# Altium schematic sheet A313-2.SchDoc
size 817 x 513 mm
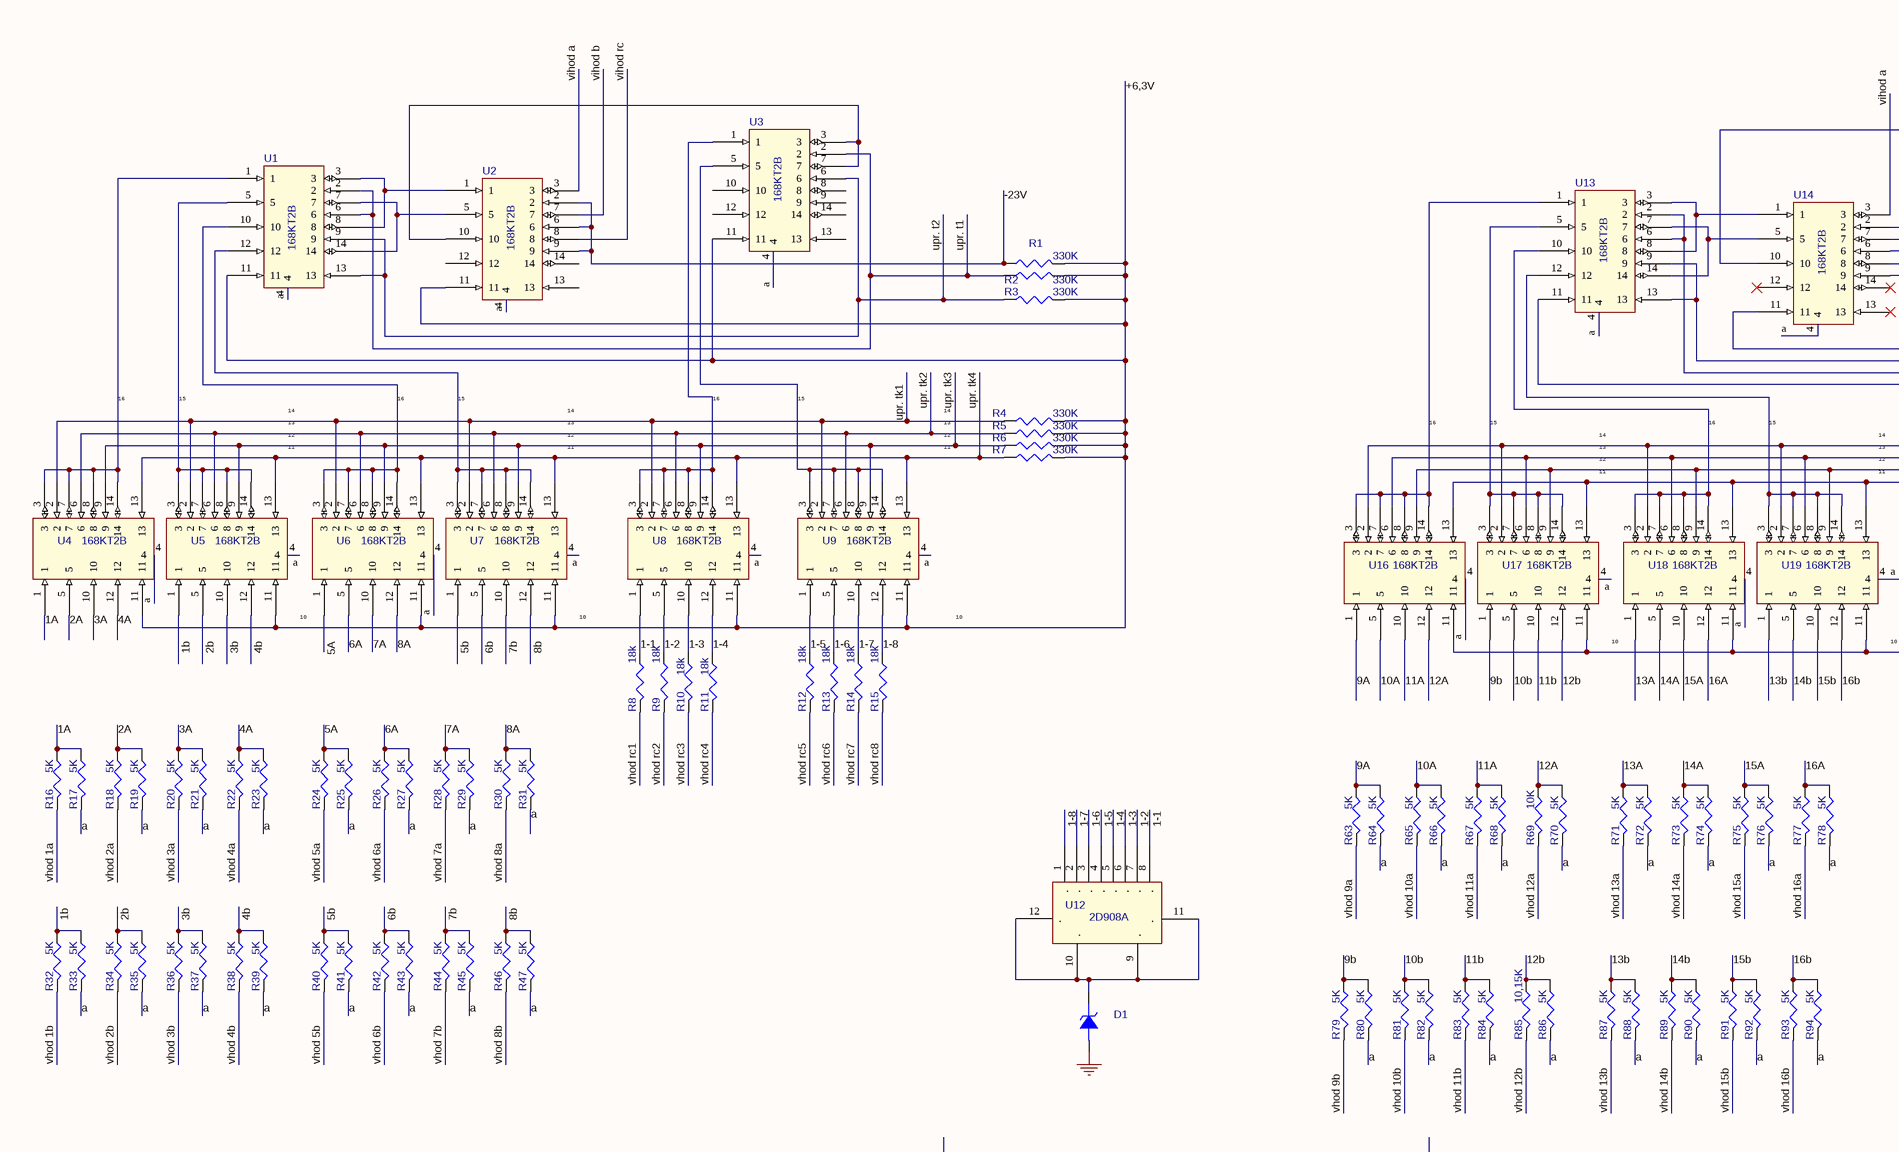
[diagram p0: A313-2.SchDoc, top left]
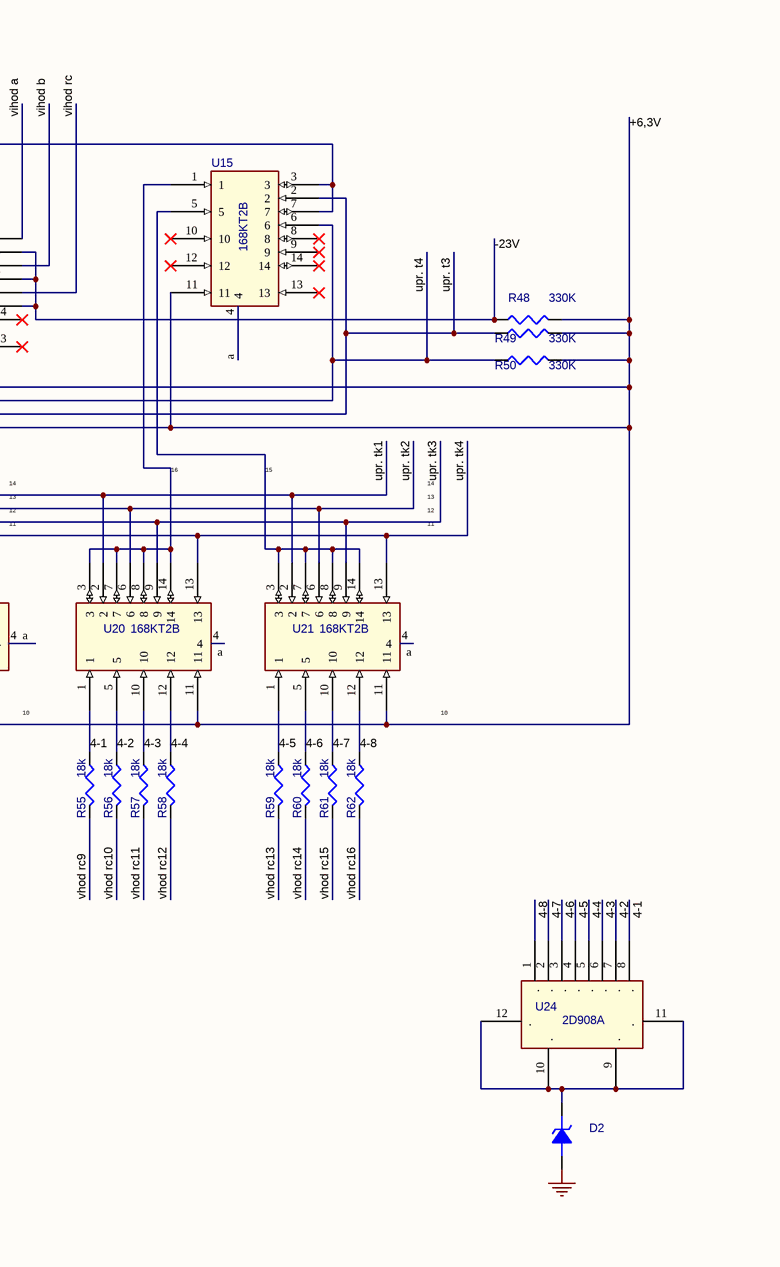
[diagram p1: A313-2.SchDoc, top right]
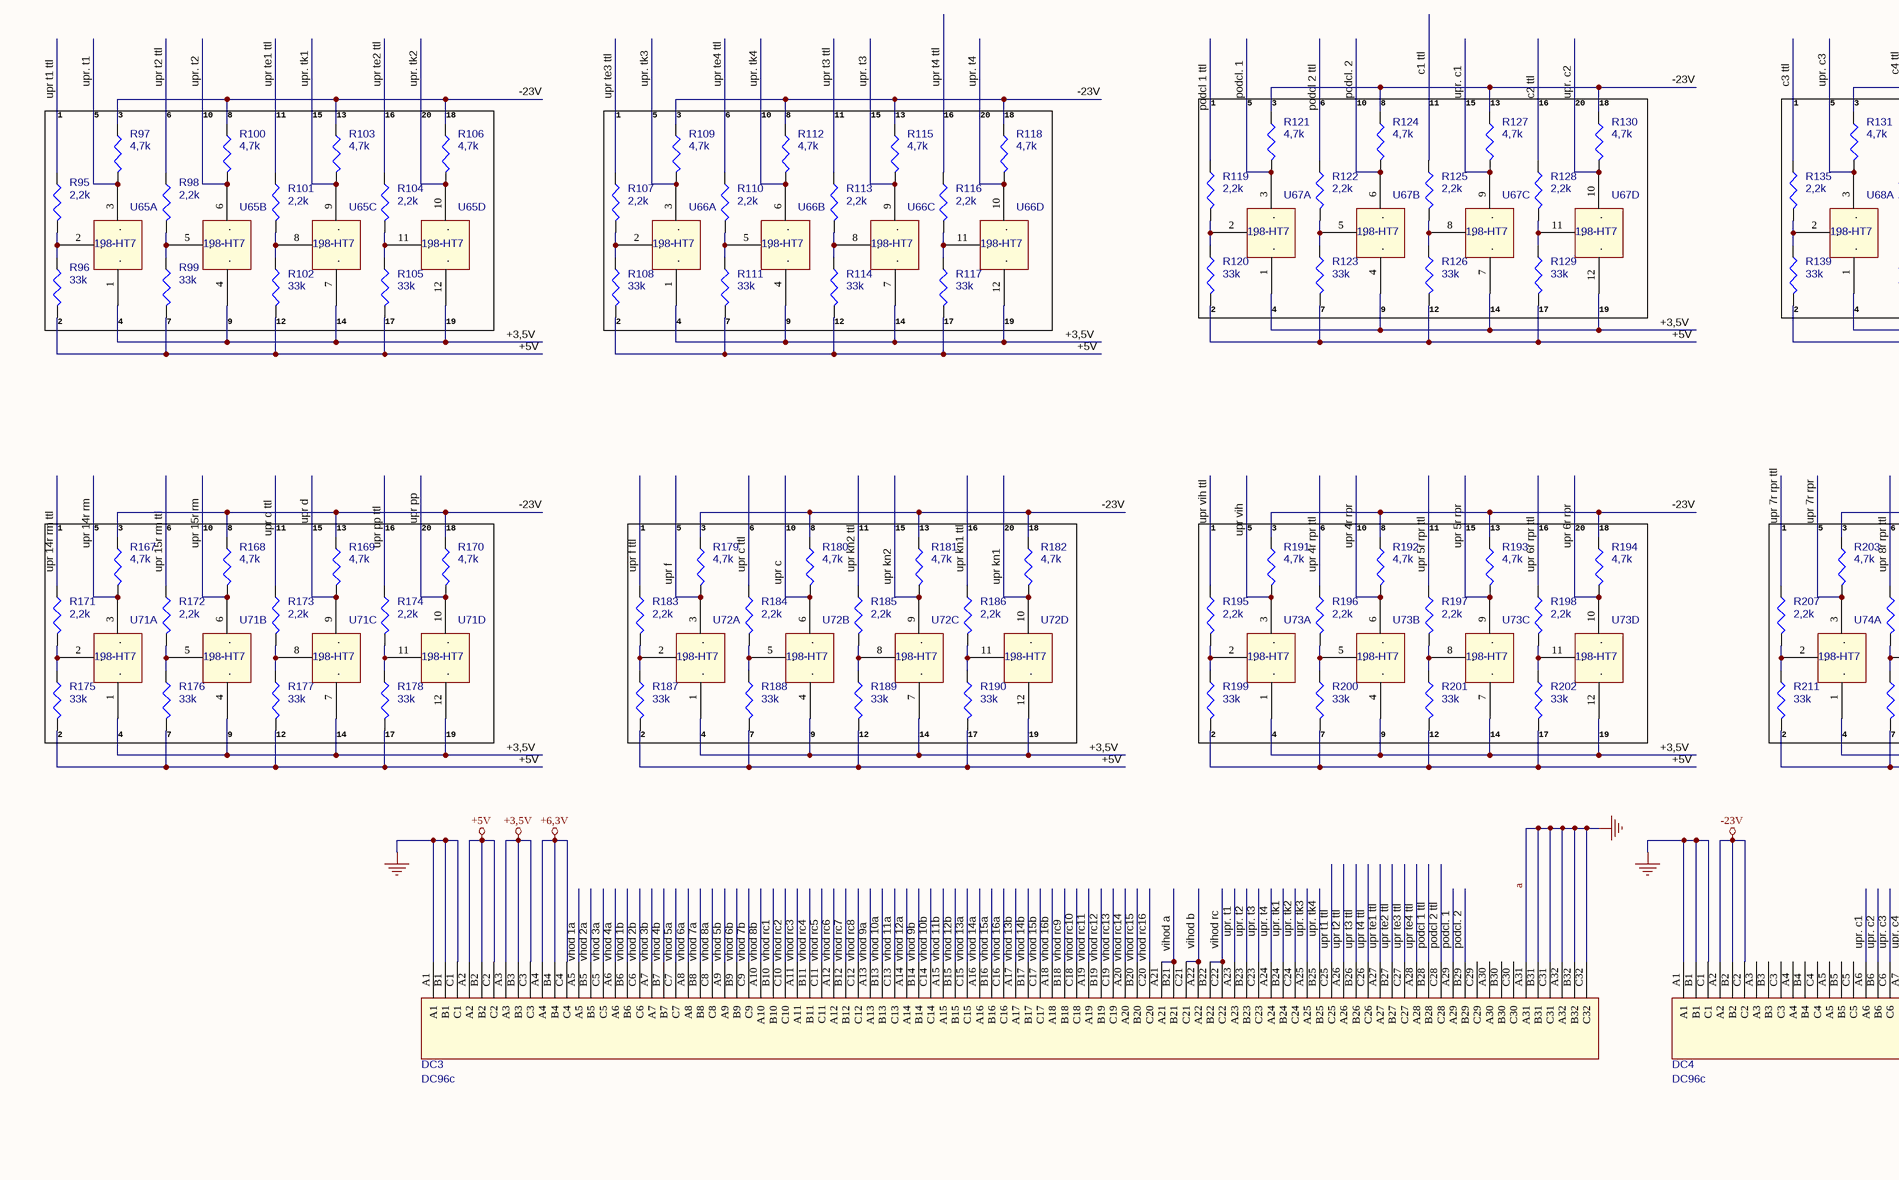
[diagram p2: A313-2.SchDoc, bottom left]
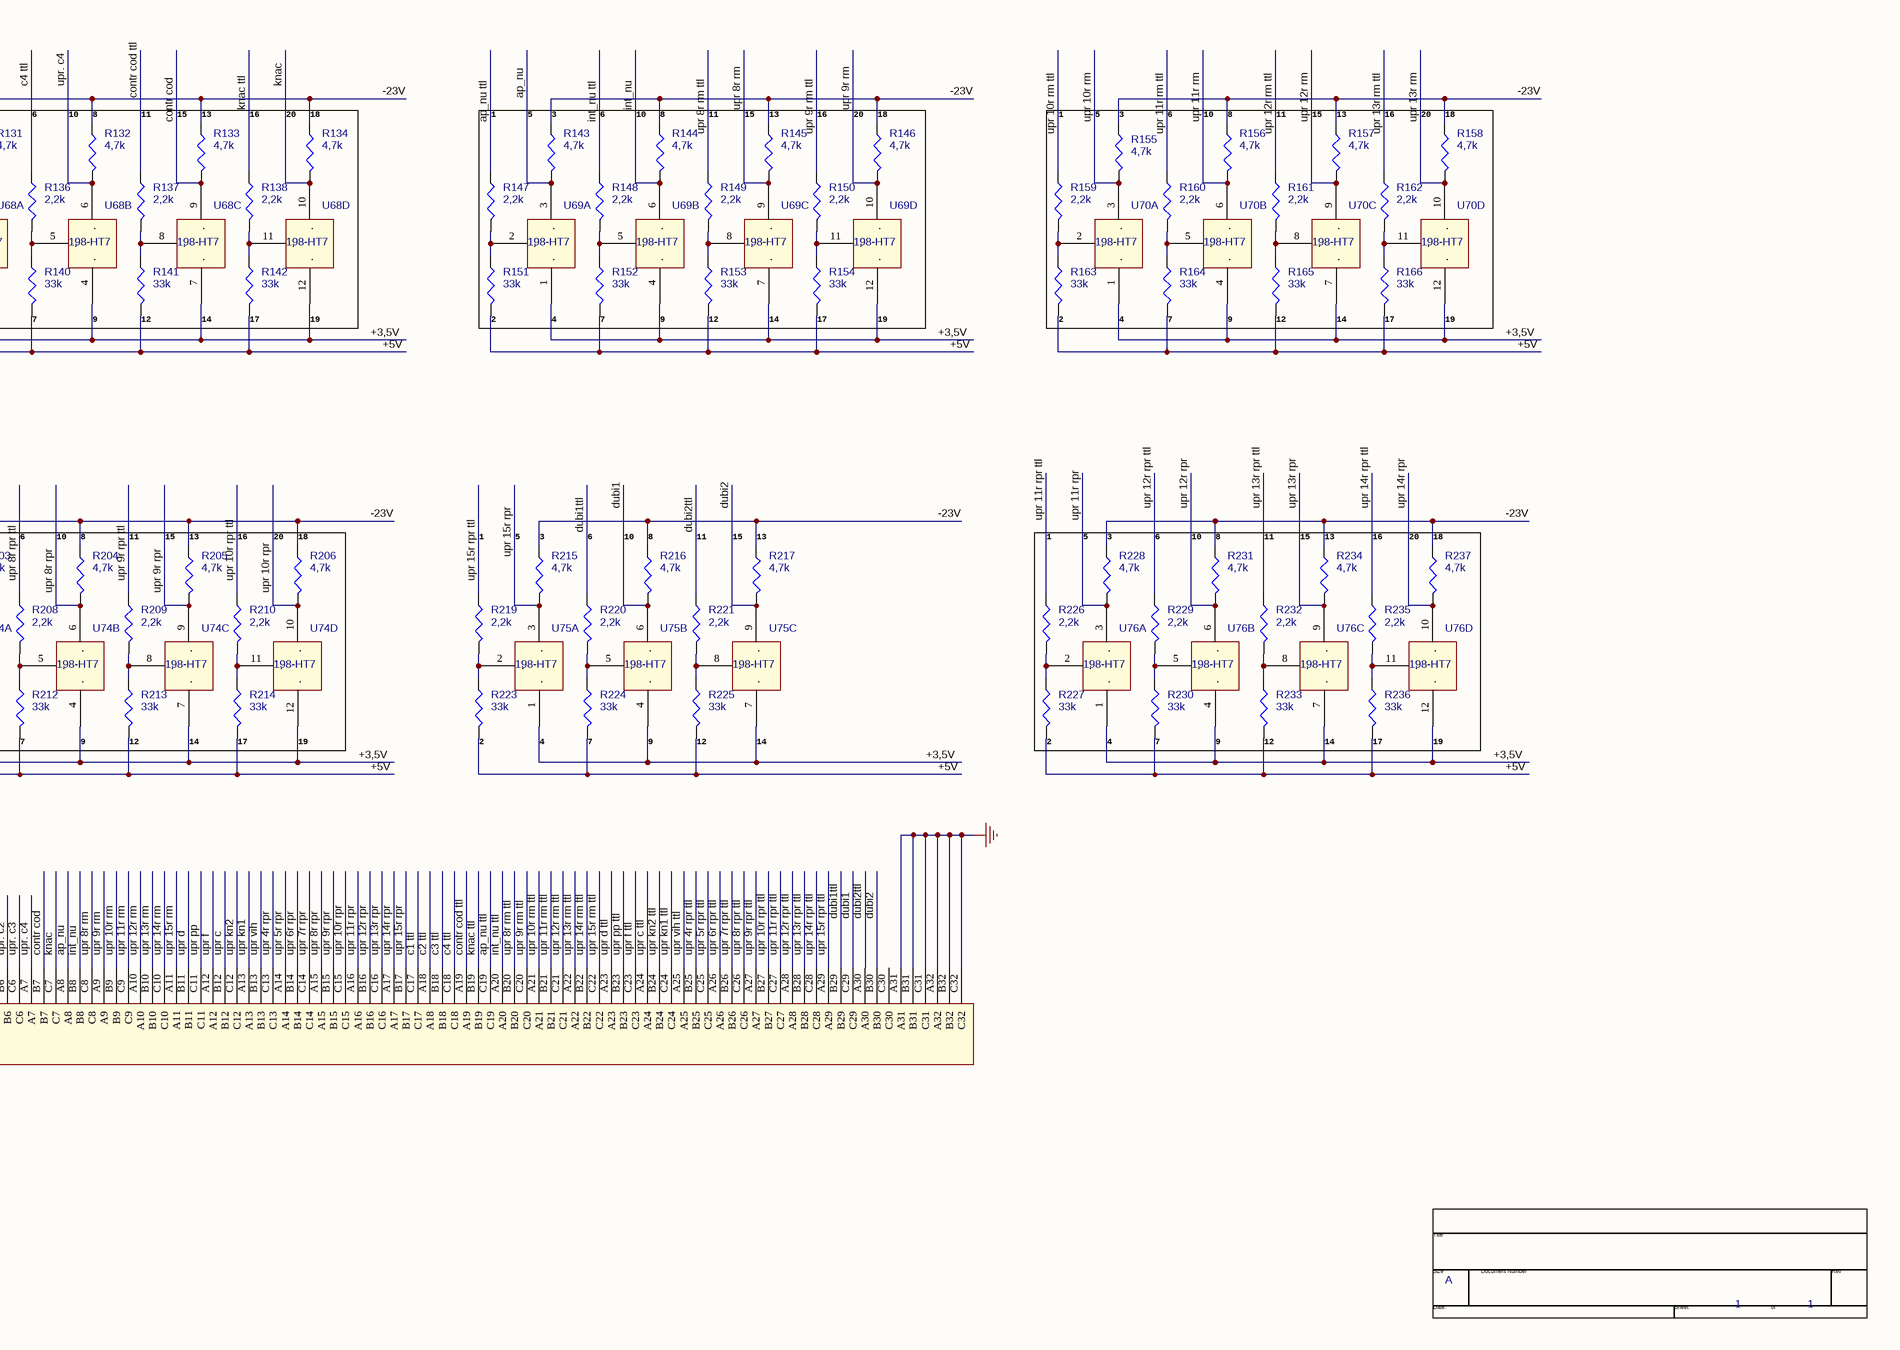
[diagram p3: A313-2.SchDoc, bottom right]

## Parts
*  Page Count: 1  Page Size: A  (hidden comment: TitleBlock0)  (graphical)
D1  2C133A  [DIODE ZENER]  (value not drawn)
D2  DIODE ZENER  [DIODE ZENER]  (value not drawn)
DC3  DC96c  [DC96c_DUC]
DC4  DC96c  [DC96c_DUC]
R1  330K  [R0805]
R2  330K  [R0805]
R3  330K  [R0805]
R4  330K  [R0805]
R5  330K  [R0805]
R6  330K  [R0805]
R7  330K  [R0805]
R8  18k  [R0805]
R9  18k  [R0805]
R10  18k  [R0805]
R11  18k  [R0805]
R12  18k  [R0805]
R13  18k  [R0805]
R14  18k  [R0805]
R15  18k  [R0805]
R16  5K  [R0805]
R17  5K  [R0805]
R18  5K  [R0805]
R19  5K  [R0805]
R20  5K  [R0805]
R21  5K  [R0805]
R22  5K  [R0805]
R23  5K  [R0805]
R24  5K  [R0805]
R25  5K  [R0805]
R26  5K  [R0805]
R27  5K  [R0805]
R28  5K  [R0805]
R29  5K  [R0805]
R30  5K  [R0805]
R31  5K  [R0805]
R32  5K  [R0805]
R33  5K  [R0805]
R34  5K  [R0805]
R35  5K  [R0805]
R36  5K  [R0805]
R37  5K  [R0805]
R38  5K  [R0805]
R39  5K  [R0805]
R40  5K  [R0805]
R41  5K  [R0805]
R42  5K  [R0805]
R43  5K  [R0805]
R44  5K  [R0805]
R45  5K  [R0805]
R46  5K  [R0805]
R47  5K  [R0805]
R48  330K  [R0805]
R49  330K  [R0805]
R50  330K  [R0805]
R55  18k  [R0805]
R56  18k  [R0805]
R57  18k  [R0805]
R58  18k  [R0805]
R59  18k  [R0805]
R60  18k  [R0805]
R61  18k  [R0805]
R62  18k  [R0805]
R63  5K  [R0805]
R64  5K  [R0805]
R65  5K  [R0805]
R66  5K  [R0805]
R67  5K  [R0805]
R68  5K  [R0805]
R69  10K  [R0805]
R70  5K  [R0805]
R71  5K  [R0805]
R72  5K  [R0805]
R73  5K  [R0805]
R74  5K  [R0805]
R75  5K  [R0805]
R76  5K  [R0805]
R77  5K  [R0805]
R78  5K  [R0805]
R79  5K  [R0805]
R80  5K  [R0805]
R81  5K  [R0805]
R82  5K  [R0805]
R83  5K  [R0805]
R84  5K  [R0805]
R85  10,15K  [R0805]
R86  5K  [R0805]
R87  5K  [R0805]
R88  5K  [R0805]
R89  5K  [R0805]
R90  5K  [R0805]
R91  5K  [R0805]
R92  5K  [R0805]
R93  5K  [R0805]
R94  5K  [R0805]
R95  2,2k  [R0805]
R96  33k  [R0805]
R97  4,7k  [R0805]
R98  2,2k  [R0805]
R99  33k  [R0805]
R100  4,7k  [R0805]
R101  2,2k  [R0805]
R102  33k  [R0805]
R103  4,7k  [R0805]
R104  2,2k  [R0805]
R105  33k  [R0805]
R106  4,7k  [R0805]
R107  2,2k  [R0805]
R108  33k  [R0805]
R109  4,7k  [R0805]
R110  2,2k  [R0805]
R111  33k  [R0805]
R112  4,7k  [R0805]
R113  2,2k  [R0805]
R114  33k  [R0805]
R115  4,7k  [R0805]
R116  2,2k  [R0805]
R117  33k  [R0805]
R118  4,7k  [R0805]
R119  2,2k  [R0805]
R120  33k  [R0805]
R121  4,7k  [R0805]
R122  2,2k  [R0805]
R123  33k  [R0805]
R124  4,7k  [R0805]
R125  2,2k  [R0805]
R126  33k  [R0805]
R127  4,7k  [R0805]
R128  2,2k  [R0805]
R129  33k  [R0805]
R130  4,7k  [R0805]
R131  4,7k  [R0805]
R132  4,7k  [R0805]
R133  4,7k  [R0805]
R134  4,7k  [R0805]
R135  2,2k  [R0805]
R136  2,2k  [R0805]
R137  2,2k  [R0805]
R138  2,2k  [R0805]
R139  33k  [R0805]
R140  33k  [R0805]
R141  33k  [R0805]
R142  33k  [R0805]
R143  4,7k  [R0805]
R144  4,7k  [R0805]
R145  4,7k  [R0805]
R146  4,7k  [R0805]
R147  2,2k  [R0805]
R148  2,2k  [R0805]
R149  2,2k  [R0805]
R150  2,2k  [R0805]
R151  33k  [R0805]
R152  33k  [R0805]
R153  33k  [R0805]
R154  33k  [R0805]
R155  4,7k  [R0805]
R156  4,7k  [R0805]
R157  4,7k  [R0805]
R158  4,7k  [R0805]
R159  2,2k  [R0805]
R160  2,2k  [R0805]
R161  2,2k  [R0805]
R162  2,2k  [R0805]
R163  33k  [R0805]
R164  33k  [R0805]
R165  33k  [R0805]
R166  33k  [R0805]
R167  4,7k  [R0805]
R168  4,7k  [R0805]
R169  4,7k  [R0805]
R170  4,7k  [R0805]
R171  2,2k  [R0805]
R172  2,2k  [R0805]
R173  2,2k  [R0805]
R174  2,2k  [R0805]
R175  33k  [R0805]
R176  33k  [R0805]
R177  33k  [R0805]
R178  33k  [R0805]
R179  4,7k  [R0805]
R180  4,7k  [R0805]
R181  4,7k  [R0805]
R182  4,7k  [R0805]
R183  2,2k  [R0805]
R184  2,2k  [R0805]
R185  2,2k  [R0805]
R186  2,2k  [R0805]
R187  33k  [R0805]
R188  33k  [R0805]
R189  33k  [R0805]
R190  33k  [R0805]
R191  4,7k  [R0805]
R192  4,7k  [R0805]
R193  4,7k  [R0805]
R194  4,7k  [R0805]
R195  2,2k  [R0805]
R196  2,2k  [R0805]
R197  2,2k  [R0805]
R198  2,2k  [R0805]
R199  33k  [R0805]
R200  33k  [R0805]
R201  33k  [R0805]
R202  33k  [R0805]
R203  4,7k  [R0805]
R204  4,7k  [R0805]
R205  4,7k  [R0805]
R206  4,7k  [R0805]
R207  2,2k  [R0805]
R208  2,2k  [R0805]
R209  2,2k  [R0805]
R210  2,2k  [R0805]
R211  33k  [R0805]
R212  33k  [R0805]
R213  33k  [R0805]
R214  33k  [R0805]
R215  4,7k  [R0805]
R216  4,7k  [R0805]
R217  4,7k  [R0805]
R219  2,2k  [R0805]
R220  2,2k  [R0805]
R221  2,2k  [R0805]
R223  33k  [R0805]
R224  33k  [R0805]
R225  33k  [R0805]
R226  2,2k  [R0805]
R227  33k  [R0805]
R228  4,7k  [R0805]
R229  2,2k  [R0805]
R230  33k  [R0805]
R231  4,7k  [R0805]
R232  2,2k  [R0805]
R233  33k  [R0805]
R234  4,7k  [R0805]
R235  2,2k  [R0805]
R236  33k  [R0805]
R237  4,7k  [R0805]
U1  168KT2B  [168kt2b]
U2  168KT2B  [168kt2b]
U3  168KT2B  [168kt2b]
U4  168KT2B  [168kt2b]
U5  168KT2B  [168kt2b]
U6  168KT2B  [168kt2b]
U7  168KT2B  [168kt2b]
U8  168KT2B  [168kt2b]
U9  168KT2B  [168kt2b]
U12  2D908A  [2d908a]
U13  168KT2B  [168kt2b]
U14  168KT2B  [168kt2b]
U15  168KT2B  [168kt2b]
U16  168KT2B  [168kt2b]
U17  168KT2B  [168kt2b]
U18  168KT2B  [168kt2b]
U19  168KT2B  [168kt2b]
U20  168KT2B  [168kt2b]
U21  168KT2B  [168kt2b]
U24  2D908A  [2d908a]
U65  198-HT7  [198-ht7]  (parts A,B,C,D of 4)
U66  198-HT7  [198-ht7]  (parts A,B,C,D of 4)
U67  198-HT7  [198-ht7]  (parts A,B,C,D of 4)
U68  198-HT7  [198-ht7]  (parts A,B,C,D of 4)
U69  198-HT7  [198-ht7]  (parts A,B,C,D of 4)
U70  198-HT7  [198-ht7]  (parts A,B,C,D of 4)
U71  198-HT7  [198-ht7]  (parts A,B,C,D of 4)
U72  198-HT7  [198-ht7]  (parts A,B,C,D of 4)
U73  198-HT7  [198-ht7]  (parts A,B,C,D of 4)
U74  198-HT7  [198-ht7]  (parts A,B,C,D of 4)
U75  198-HT7  [198-ht7]  (parts A,B,C of 4)
U76  198-HT7  [198-ht7]  (parts A,B,C,D of 4)

## Nets
+3,5V: DC3.A3 DC3.B3 DC3.C3 U65.1(.) U65.4(.) U65.7(.) U65.12(.) U66.1(.) U66.4(.) U66.7(.) U66.12(.) U67.1(.) U67.4(.) U67.7(.) U67.12(.) U68.1(.) U68.4(.) U68.7(.) U68.12(.) U69.1(.) U69.4(.) U69.7(.) U69.12(.) U70.1(.) U70.4(.) U70.7(.) U70.12(.) U71.1(.) U71.4(.) U71.7(.) U71.12(.) U72.1(.) U72.4(.) U72.7(.) U72.12(.) U73.1(.) U73.4(.) U73.7(.) U73.12(.) U74.1(.) U74.4(.) U74.7(.) U74.12(.) U75.1(.) U75.4(.) U75.7(.) U76.1(.) U76.4(.) U76.7(.) U76.12(.)
+5V: DC3.A2 DC3.B2 DC3.C2 R96.2 R99.2 R102.2 R105.2 R108.2 R111.2 R114.2 R117.2 R120.2 R123.2 R126.2 R129.2 R139.2 R140.2 R141.2 R142.2 R151.2 R152.2 R153.2 R154.2 R163.2 R164.2 R165.2 R166.2 R175.2 R176.2 R177.2 R178.2 R187.2 R188.2 R189.2 R190.2 R199.2 R200.2 R201.2 R202.2 R211.2 R212.2 R213.2 R214.2 R223.2 R224.2 R225.2 R227.2 R230.2 R233.2 R236.2
+6,3V: DC3.A4 DC3.B4 DC3.C4 R1.2 R2.2 R3.2 R4.2 R5.2 R6.2 R7.2 R48.2 R49.2 R50.2 U1.11 U2.11 U3.11 U4.11 U5.11 U6.11 U7.11 U8.11 U9.11 U13.11 U14.11 U15.11 U16.11 U17.11 U18.11 U19.11 U20.11 U21.11
-23V: DC4.A2 DC4.A19 DC4.B2 DC4.C2 R1.1 R48.1 R97.1 R100.1 R103.1 R106.1 R109.1 R112.1 R115.1 R118.1 R121.1 R124.1 R127.1 R130.1 R131.1 R132.1 R133.1 R134.1 R137.1 R143.1 R144.1 R145.1 R146.1 R155.1 R156.1 R157.1 R158.1 R167.1 R168.1 R169.1 R170.1 R179.1 R180.1 R181.1 R182.1 R191.1 R192.1 R193.1 R194.1 R203.1 R204.1 R205.1 R206.1 R215.1 R216.1 R217.1 R228.1 R231.1 R234.1 R237.1 U2.2 U2.6 U2.9 U14.2 U14.6 U14.9  [also labelled contr cod ttl]
.: U65.13(.) U65.14(.) U66.13(.) U66.14(.) U67.13(.) U67.14(.) U68.13(.) U68.14(.) U69.13(.) U69.14(.) U70.13(.) U70.14(.) U71.13(.) U71.14(.) U72.13(.) U72.14(.) U73.13(.) U73.14(.) U74.13(.) U74.14(.) U75.13(.) U75.14(.) U76.13(.) U76.14(.)
a: D1.1(ANODE) D2.1(ANODE) DC3.A1 DC3.A31 DC3.A32 DC3.B1 DC3.B31 DC3.B32 DC3.C1 DC3.C31 DC3.C32 DC4.A1 DC4.A31 DC4.A32 DC4.B1 DC4.B31 DC4.B32 DC4.C1 DC4.C31 DC4.C32 R17.2 R19.2 R21.2 R23.2 R25.2 R27.2 R29.2 R31.2 R33.2 R35.2 R37.2 R39.2 R41.2 R43.2 R45.2 R47.2 R64.2 R66.2 R68.2 R70.2 R72.2 R74.2 R76.2 R78.2 R80.2 R82.2 R84.2 R86.2 R88.2 R90.2 R92.2 R94.2 U1.4 U2.4 U3.4 U4.4 U5.4 U6.4 U7.4 U8.4 U9.4 U13.4 U14.4 U15.4 U16.4 U17.4 U18.4 U19.4 U20.4 U21.4  [also labelled GND]
1-1: R8.1 U8.1 U12.8(.)
1-2: R9.1 U8.5 U12.7(.)
1-3: R10.1 U8.10 U12.6(.)
1-4: R11.1 U8.12 U12.5(.)
1-5: R12.1 U9.1 U12.4(.)
1-6: R13.1 U9.5 U12.3(.)
1-7: R14.1 U9.10 U12.2(.)
1-8: R15.1 U9.12 U12.1(.)
1A: R16.1 R17.1 U4.1
1b: R32.1 R33.1 U5.1
2A: R18.1 R19.1 U4.5
2b: R34.1 R35.1 U5.5
3A: R20.1 R21.1 U4.10
3b: R36.1 R37.1 U5.10
4-1: R55.1 U20.1 U24.8(.)
4-2: R56.1 U20.5 U24.7(.)
4-3: R57.1 U20.10 U24.6(.)
4-4: R58.1 U20.12 U24.5(.)
4-5: R59.1 U21.1 U24.4(.)
4-6: R60.1 U21.5 U24.3(.)
4-7: R61.1 U21.10 U24.2(.)
4-8: R62.1 U21.12 U24.1(.)
4A: R22.1 R23.1 U4.12
4b: R38.1 R39.1 U5.12
5A: R24.1 R25.1 U6.1
5b: R40.1 R41.1 U7.1
6A: R26.1 R27.1 U6.5
6b: R42.1 R43.1 U7.5
7A: R28.1 R29.1 U6.10
7b: R44.1 R45.1 U7.10
8A: R30.1 R31.1 U6.12
8b: R46.1 R47.1 U7.12
9A: R63.1 R64.1 U16.1
9b: R79.1 R80.1 U17.1
10A: R65.1 R66.1 U16.5
10b: R81.1 R82.1 U17.5
11A: R67.1 R68.1 U16.10
11b: R83.1 R84.1 U17.10
12A: R69.1 R70.1 U16.12
12b: R85.1 R86.1 U17.12
13A: R71.1 R72.1 U18.1
13b: R87.1 R88.1 U19.1
14A: R73.1 R74.1 U18.5
14b: R89.1 R90.1 U19.5
15A: R75.1 R76.1 U18.10
15b: R91.1 R92.1 U19.10
16A: R77.1 R78.1 U18.12
16b: R93.1 R94.1 U19.12
ap_nu: DC4.A8 R143.2 U69.3(.)
ap_nu ttl: DC4.C19 R147.1
c1 ttl: DC4.C17 R125.1
c2 ttl: DC4.A18 R128.1
c3 ttl: DC4.B18 R135.1
c4 ttl: DC4.C18 R136.1
contr cod: DC4.B7 R133.2 U68.9(.)
dubi1: DC4.C29 R216.2 U75.6(.)
dubi1ttl: DC4.B29 R220.1
dubi2: DC4.B30 R217.2 U75.9(.)
dubi2ttl: DC4.A30 R221.1
int_nu: DC4.B8 R144.2 U69.6(.)
int_nu ttl: DC4.A20 R148.1
knac: DC4.C7 R134.2 U68.10(.)
knac ttl: DC4.B19 R138.1
podcl 1 ttl: DC3.B28 R119.1
podcl 2 ttl: DC3.C28 R122.1
podcl. 1: DC3.A29 R121.2 U67.3(.)
podcl. 2: DC3.B29 R124.2 U67.6(.)
upr 4r rpr: DC4.C13 R192.2 U73.6(.)
upr 4r rpr ttl: DC4.B25 R196.1
upr 5r rpr: DC4.A14 R193.2 U73.9(.)
upr 5r rpr ttl: DC4.C25 R197.1
upr 6r rpr: DC4.B14 R194.2 U73.10(.)
upr 6r rpr ttl: DC4.A26 R198.1
upr 7r rpr: DC4.C14 R203.2 U74.3(.)
upr 7r rpr ttl: DC4.B26 R207.1
upr 8r rm: DC4.C8 R145.2 U69.9(.)
upr 8r rm ttl: DC4.B20 R149.1
upr 8r rpr: DC4.A15 R204.2 U74.6(.)
upr 8r rpr ttl: DC4.C26 R208.1
upr 9r rm: DC4.A9 R146.2 U69.10(.)
upr 9r rm ttl: DC4.C20 R150.1
upr 9r rpr: DC4.B15 R205.2 U74.9(.)
upr 9r rpr ttl: DC4.A27 R209.1
upr 10r rm: DC4.B9 R155.2 U70.3(.)
upr 10r rm ttl: DC4.A21 R159.1
upr 10r rpr: DC4.C15 R206.2 U74.10(.)
upr 10r rpr ttl: DC4.B27 R210.1
upr 11r rm: DC4.C9 R156.2 U70.6(.)
upr 11r rm ttl: DC4.B21 R160.1
upr 11r rpr: DC4.A16 R228.2 U76.3(.)
upr 11r rpr ttl: DC4.C27 R226.1
upr 12r rm: DC4.A10 R157.2 U70.9(.)
upr 12r rm ttl: DC4.C21 R161.1
upr 12r rpr: DC4.B16 R231.2 U76.6(.)
upr 12r rpr ttl: DC4.A28 R229.1
upr 13r rm: DC4.B10 R158.2 U70.10(.)
upr 13r rm ttl: DC4.A22 R162.1
upr 13r rpr: DC4.C16 R234.2 U76.9(.)
upr 13r rpr ttl: DC4.B28 R232.1
upr 14r rm: DC4.C10 R167.2 U71.3(.)
upr 14r rm ttl: DC4.B22 R171.1
upr 14r rpr: DC4.A17 R237.2 U76.10(.)
upr 14r rpr ttl: DC4.C28 R235.1
upr 15r rm: DC4.A11 R168.2 U71.6(.)
upr 15r rm ttl: DC4.C22 R172.1
upr 15r rpr: DC4.B17 R215.2 U75.3(.)
upr 15r rpr ttl: DC4.A29 R219.1
upr c: DC4.B12 R180.2 U72.6(.)
upr c ttl: DC4.A24 R184.1
upr d: DC4.B11 R169.2 U71.9(.)
upr d ttl: DC4.A23 R173.1
upr f: DC4.A12 R179.2 U72.3(.)
upr f ttl: DC4.C23 R183.1
upr kn1: DC4.A13 R182.2 U72.10(.)
upr kn1 ttl: DC4.C24 R186.1
upr kn2: DC4.C12 R181.2 U72.9(.)
upr kn2 ttl: DC4.B24 R185.1
upr pp: DC4.C11 R170.2 U71.10(.)
upr pp ttl: DC4.B23 R174.1
upr t1 ttl: DC3.C25 R95.1
upr t2 ttl: DC3.A26 R98.1
upr t3 ttl: DC3.B26 R113.1
upr t4 ttl: DC3.C26 R116.1
upr te1 ttl: DC3.A27 R101.1
upr te2 ttl: DC3.B27 R104.1
upr te3 ttl: DC3.C27 R107.1
upr te4 ttl: DC3.A28 R110.1
upr vih: DC4.B13 R191.2 U73.3(.)
upr vih ttl: DC4.A25 R195.1
upr. c1: DC4.A6 R127.2 U67.9(.)
upr. c2: DC4.B6 R130.2 U67.10(.)
upr. c3: DC4.C6 R131.2 U68.3(.)
upr. c4: DC4.A7 R132.2 U68.6(.)
upr. t1: DC3.A23 R2.1 R97.2 U1.2 U1.6 U3.2 U65.3(.)
upr. t2: DC3.B23 R3.1 R100.2 U1.9 U1.13 U3.6 U65.6(.)
upr. t3: DC3.C23 R49.1 R115.2 U13.2 U13.6 U15.2 U66.9(.)
upr. t4: DC3.A24 R50.1 R118.2 U13.9 U13.13 U15.6 U66.10(.)
upr. tk1: DC3.B24 R4.1 R103.2 U4.2 U5.2 U6.2 U7.2 U8.2 U9.2 U16.2 U17.2 U18.2 U19.2 U20.2 U21.2 U65.9(.)
upr. tk2: DC3.C24 R5.1 R106.2 U4.6 U5.6 U6.6 U7.6 U8.6 U9.6 U16.6 U17.6 U18.6 U19.6 U20.6 U21.6 U65.10(.)
upr. tk3: DC3.A25 R6.1 R109.2 U4.9 U5.9 U6.9 U7.9 U8.9 U9.9 U16.9 U17.9 U18.9 U19.9 U20.9 U21.9 U66.3(.)
upr. tk4: DC3.B25 R7.1 R112.2 U4.13 U5.13 U6.13 U7.13 U8.13 U9.13 U16.13 U17.13 U18.13 U19.13 U20.13 U21.13 U66.6(.)
vhod 1a: DC3.A5 R16.2
vhod 1b: DC3.B6 R32.2
vhod 2a: DC3.B5 R18.2
vhod 2b: DC3.C6 R34.2
vhod 3a: DC3.C5 R20.2
vhod 3b: DC3.A7 R36.2
vhod 4a: DC3.A6 R22.2
vhod 4b: DC3.B7 R38.2
vhod 5a: DC3.C7 R24.2
vhod 5b: DC3.A9 R40.2
vhod 6a: DC3.A8 R26.2
vhod 6b: DC3.B9 R42.2
vhod 7a: DC3.B8 R28.2
vhod 7b: DC3.C9 R44.2
vhod 8a: DC3.C8 R30.2
vhod 8b: DC3.A10 R46.2
vhod 9a: DC3.A13 R63.2
vhod 9b: DC3.B14 R79.2
vhod 10a: DC3.B13 R65.2
vhod 10b: DC3.C14 R81.2
vhod 11a: DC3.C13 R67.2
vhod 11b: DC3.A15 R83.2
vhod 12a: DC3.A14 R69.2
vhod 12b: DC3.B15 R85.2
vhod 13a: DC3.C15 R71.2
vhod 13b: DC3.A17 R87.2
vhod 14a: DC3.A16 R73.2
vhod 14b: DC3.B17 R89.2
vhod 15a: DC3.B16 R75.2
vhod 15b: DC3.C17 R91.2
vhod 16a: DC3.C16 R77.2
vhod 16b: DC3.A18 R93.2
vhod rc1: DC3.B10 R8.2
vhod rc2: DC3.C10 R9.2
vhod rc3: DC3.A11 R10.2
vhod rc4: DC3.B11 R11.2
vhod rc5: DC3.C11 R12.2
vhod rc6: DC3.A12 R13.2
vhod rc7: DC3.B12 R14.2
vhod rc8: DC3.C12 R15.2
vhod rc9: DC3.B18 R55.2
vhod rc10: DC3.C18 R56.2
vhod rc11: DC3.A19 R57.2
vhod rc12: DC3.B19 R58.2
vhod rc13: DC3.C19 R59.2
vhod rc14: DC3.A20 R60.2
vhod rc15: DC3.B20 R61.2
vhod rc16: DC3.C20 R62.2
vihod a: DC3.A21 DC3.B21 U2.3 U14.3
vihod b: DC3.A22 DC3.C21 U2.7 U14.7
vihod rc: DC3.B22 DC3.C22 U2.8 U14.8
NetD1_2: D1.2(CATHODE) U12.9(.) U12.10(.) U12.11(.) U12.12(.)
NetD2_2: D2.2(CATHODE) U24.9(.) U24.10(.) U24.11(.) U24.12(.)
NetR95_2: R95.2 R96.1 U65.2(.)
NetR98_2: R98.2 R99.1 U65.5(.)
NetR101_2: R101.2 R102.1 U65.8(.)
NetR104_2: R104.2 R105.1 U65.11(.)
NetR107_2: R107.2 R108.1 U66.2(.)
NetR110_2: R110.2 R111.1 U66.5(.)
NetR113_2: R113.2 R114.1 U66.8(.)
NetR116_2: R116.2 R117.1 U66.11(.)
NetR119_2: R119.2 R120.1 U67.2(.)
NetR122_2: R122.2 R123.1 U67.5(.)
NetR125_2: R125.2 R126.1 U67.8(.)
NetR128_2: R128.2 R129.1 U67.11(.)
NetR135_2: R135.2 R139.1 U68.2(.)
NetR136_2: R136.2 R140.1 U68.5(.)
NetR137_2: R137.2 R141.1 U68.8(.)
NetR138_2: R138.2 R142.1 U68.11(.)
NetR147_2: R147.2 R151.1 U69.2(.)
NetR148_2: R148.2 R152.1 U69.5(.)
NetR149_2: R149.2 R153.1 U69.8(.)
NetR150_2: R150.2 R154.1 U69.11(.)
NetR159_2: R159.2 R163.1 U70.2(.)
NetR160_2: R160.2 R164.1 U70.5(.)
NetR161_2: R161.2 R165.1 U70.8(.)
NetR162_2: R162.2 R166.1 U70.11(.)
NetR171_2: R171.2 R175.1 U71.2(.)
NetR172_2: R172.2 R176.1 U71.5(.)
NetR173_2: R173.2 R177.1 U71.8(.)
NetR174_2: R174.2 R178.1 U71.11(.)
NetR183_2: R183.2 R187.1 U72.2(.)
NetR184_2: R184.2 R188.1 U72.5(.)
NetR185_2: R185.2 R189.1 U72.8(.)
NetR186_2: R186.2 R190.1 U72.11(.)
NetR195_2: R195.2 R199.1 U73.2(.)
NetR196_2: R196.2 R200.1 U73.5(.)
NetR197_2: R197.2 R201.1 U73.8(.)
NetR198_2: R198.2 R202.1 U73.11(.)
NetR207_2: R207.2 R211.1 U74.2(.)
NetR208_2: R208.2 R212.1 U74.5(.)
NetR209_2: R209.2 R213.1 U74.8(.)
NetR210_2: R210.2 R214.1 U74.11(.)
NetR219_2: R219.2 R223.1 U75.2(.)
NetR220_2: R220.2 R224.1 U75.5(.)
NetR221_2: R221.2 R225.1 U75.8(.)
NetR226_2: R226.2 R227.1 U76.2(.)
NetR229_2: R229.2 R230.1 U76.5(.)
NetR232_2: R232.2 R233.1 U76.8(.)
NetR235_2: R235.2 R236.1 U76.11(.)
NetU1_1: U1.1 U4.3 U4.7 U4.8 U4.14
NetU1_3: U1.3 U1.8 U2.1
NetU1_5: U1.5 U5.3 U5.7 U5.8 U5.14
NetU1_7: U1.7 U1.14 U2.5
NetU1_10: U1.10 U6.3 U6.7 U6.8 U6.14
NetU1_12: U1.12 U7.3 U7.7 U7.8 U7.14
NetU2_10: U2.10 U3.3 U3.7
NetU3_1: U3.1 U8.3 U8.7 U8.8 U8.14
NetU3_5: U3.5 U9.3 U9.7 U9.8 U9.14
NetU13_1: U13.1 U16.3 U16.7 U16.8 U16.14
NetU13_3: U13.3 U13.8 U14.1
NetU13_5: U13.5 U17.3 U17.7 U17.8 U17.14
NetU13_7: U13.7 U13.14 U14.5
NetU13_10: U13.10 U18.3 U18.7 U18.8 U18.14
NetU13_12: U13.12 U19.3 U19.7 U19.8 U19.14
NetU14_10: U14.10 U15.3 U15.7
NetU15_1: U15.1 U20.3 U20.7 U20.8 U20.14
NetU15_5: U15.5 U21.3 U21.7 U21.8 U21.14

Not connected (* = marked no-connect by the designer): DC3 A30 B30 C29 C30; DC4 A3 A4 A5 B3 B4 B5 C3 C4 C5 C30; U2 12 13 14; U3 8 9 10 12 13 14; U14 12* 13* 14*; U15 8* 9* 10* 12* 13* 14*

## Notes on the sheet
- 16
- 15
- 14
- 11
- 13
- 12
- 10
- (near U7) 10
- (near U19) 10
- 1
- (near R97) 5
- (near R97) 3
- 6
- (near R100) 10
- (near R100) 8
- (near R103) 15
- (near R103) 13
- (near R106) 20
- (near R106) 18
- (near R109) 5
- (near R109) 3
- (near R112) 10
- (near R112) 8
- (near R115) 15
- (near R115) 13
- (near R118) 20
- (near R118) 18
- (near R121) 5
- (near R121) 3
- (near R124) 10
- (near R124) 8
- (near R127) 15
- (near R127) 13
- (near R130) 20
- (near R130) 18
- (near R131) 5
- (near R131) 3
- (near R132) 10
- (near R132) 8
- (near R133) 15
- (near R133) 13
- (near R134) 20
- (near R134) 18
- (near R143) 5
- (near R143) 3
- (near R144) 10
- (near R144) 8
- (near R145) 15
- (near R145) 13
- (near R146) 20
- (near R146) 18
- (near R155) 5
- (near R155) 3
- (near R156) 10
- (near R156) 8
- (near R157) 15
- (near R157) 13
- (near R158) 20
- (near R158) 18
- (near R120) 2
- 4
- (near R123) 7
- 9
- (near R126) 12
- (near R129) 17
- 19
- (near R139) 2
- (near R140) 7
- (near R141) 12
- (near R142) 17
- (near R151) 2
- (near R152) 7
- (near R153) 12
- (near R154) 17
- (near R163) 2
- (near R164) 7
- (near R165) 12
- (near R166) 17
- (near R96) 2
- (near R99) 7
- (near R102) 12
- (near R105) 17
- (near R108) 2
- (near R111) 7
- (near R114) 12
- (near R117) 17
- (near R167) 5
- (near R167) 3
- (near R168) 10
- (near R168) 8
- (near R169) 15
- (near R169) 13
- (near R170) 20
- (near R170) 18
- (near R179) 5
- (near R179) 3
- (near R180) 10
- (near R180) 8
- (near R181) 15
- (near R181) 13
- (near R182) 20
- (near R182) 18
- (near R191) 5
- (near R191) 3
- (near R192) 10
- (near R192) 8
- (near R193) 15
- (near R193) 13
- (near R194) 20
- (near R194) 18
- (near R203) 5
- (near R203) 3
- (near R204) 10
- (near R204) 8
- (near R205) 15
- (near R205) 13
- (near R206) 20
- (near R206) 18
- (near R215) 5
- (near R215) 3
- (near R216) 10
- (near R216) 8
- (near R217) 15
- (near R217) 13
- (near R228) 5
- (near R228) 3
- (near R231) 10
- (near R231) 8
- (near R234) 15
- (near R234) 13
- (near R237) 20
- (near R237) 18
- (near R175) 2
- (near R176) 7
- (near R177) 12
- (near R178) 17
- (near R187) 2
- (near R188) 7
- (near R189) 12
- (near R190) 17
- (near R199) 2
- (near R200) 7
- (near R201) 12
- (near R202) 17
- (near R211) 2
- (near R212) 7
- (near R213) 12
- (near R214) 17
- (near R223) 2
- (near R224) 7
- (near R225) 12
- (near R227) 2
- (near R230) 7
- (near R233) 12
- (near R236) 17
- (in symbol TitleBlock0) Title; Size; Document Number; Rev; Date:; Sheet; of

## Library data of the parts
D1 = DIODE ZENER
R1-R50 R55-R217 R219-R221 R223-R237 = R
U1 = 168KT2B_0
U2-U9 U13-U21 = 168KT2B_5
U12 = 2D908A_1
U24 = 2D908A_2
U65-U76 = 198-HT7_0
* = TitleBlock0: Page Number: 1; Page Create Date: March  8, 1995